# Altium schematic sheet Sensor-Comms-Sheet.SchDoc
size A4; SheetNumber: 4; SheetTotal: 8
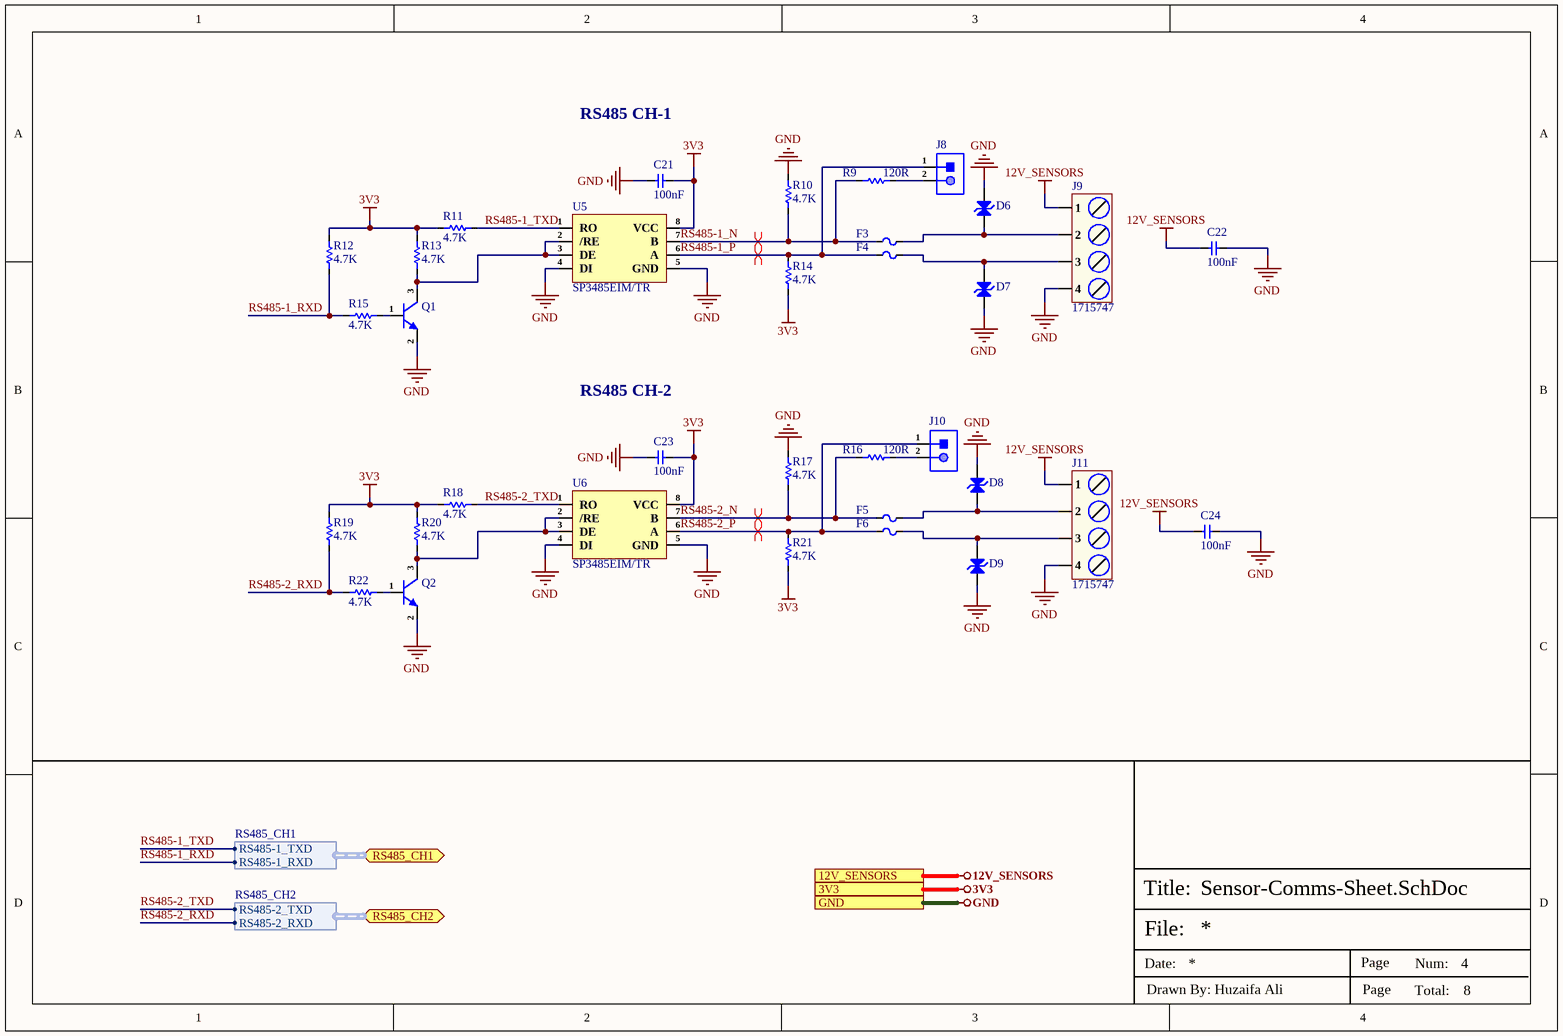
[diagram p0: Sensor-Comms-Sheet.SchDoc]

## Parts
C21  100nF  [Cap-0603]
C22  100nF  [Cap-0603]
C23  100nF  [Cap-0603]
C24  100nF  [Cap-0603]
D6  SMAJ12CA  [SMA Bi Directional]  (value not drawn)
D7  SMAJ12CA  [SMA Bi Directional]  (value not drawn)
D8  SMAJ12CA  [SMA Bi Directional]  (value not drawn)
D9  SMAJ12CA  [SMA Bi Directional]  (value not drawn)
F3  SMD0805P020TF  [Fuse-0805]  (value not drawn)
F4  SMD0805P020TF  [Fuse-0805]  (value not drawn)
F5  SMD0805P020TF  [Fuse-0805]  (value not drawn)
F6  SMD0805P020TF  [Fuse-0805]  (value not drawn)
J8  X6511WV-02H-C60D30  [HDR1X2_]  (value not drawn)
J9  1715747  [1715747]
J10  X6511WV-02H-C60D30  [HDR1X2_]  (value not drawn)
J11  1715747  [1715747]
Q1  MMBT3904M  [SOT-723]  (value not drawn)
Q2  MMBT3904M  [SOT-723]  (value not drawn)
R9  120R  [Res-0603]
R10  4.7K  [Res-0603]
R11  4.7K  [Res-0603]
R12  4.7K  [Res-0603]
R13  4.7K  [Res-0603]
R14  4.7K  [Res-0603]
R15  4.7K  [Res-0603]
R16  120R  [Res-0603]
R17  4.7K  [Res-0603]
R18  4.7K  [Res-0603]
R19  4.7K  [Res-0603]
R20  4.7K  [Res-0603]
R21  4.7K  [Res-0603]
R22  4.7K  [Res-0603]
U5  SP3485EIM/TR  [SOP-8]
U6  SP3485EIM/TR  [SOP-8]

## Ports
3V3 (see Top-Sheet[1B], ADC-Sheet[3D], Buttons-Sheet[3D], Controller-Sheet[3D], IO-Expander-Sheet[3D], Power-Sheet[3D]), 12V_SENSORS (see Top-Sheet[1B], Power-Sheet[3D]), GND (see Top-Sheet[1B], ADC-Sheet[3D], Buttons-Sheet[3D], Controller-Sheet[3D], IO-Expander-Sheet[3D], Power-Sheet[3D], Relay-Sheet[3D]), RS485_CH1 (bidir, harness RS485_CH1, see Top-Sheet[2B], Controller-Sheet[1D]), RS485_CH2 (bidir, harness RS485_CH2, see Top-Sheet[2B], Controller-Sheet[1D])

## Harnesses
RS485_CH2: RS485-2_TXD, RS485-2_RXD
RS485_CH1: RS485-1_TXD, RS485-1_RXD

## Nets
3V3: C21.1 C23.1 R11.1 R12.2 R13.2 R14.1 R18.1 R19.2 R20.2 R21.1 U5.8(VCC) U6.8(VCC) ; port 3V3
12V_SENSORS: C22.2 C24.2 J9.1 J11.1 ; port 12V_SENSORS
GND: C21.2 C22.1 C23.2 C24.1 D6.2(K) D7.1(A) D8.2(K) D9.1(A) J9.4 J11.4 Q1.2(E) Q2.2(E) R10.2 R17.2 U5.4(DI) U5.5(GND) U6.4(DI) U6.5(GND) ; port GND
RS485-1_N: F3.1 R9.1 R10.1 U5.7(B)
RS485-1_P: F4.1 J8.1 R14.2 U5.6(A)
RS485-1_RXD: R12.1 R15.2 ; port RS485_CH1.RS485-1_RXD
RS485-1_TXD: R11.2 U5.1(RO) ; port RS485_CH1.RS485-1_TXD
RS485-2_N: F5.1 R16.1 R17.1 U6.7(B)
RS485-2_P: F6.1 J10.1 R21.2 U6.6(A)
RS485-2_RXD: R19.1 R22.2 ; port RS485_CH2.RS485-2_RXD
RS485-2_TXD: R18.2 U6.1(RO) ; port RS485_CH2.RS485-2_TXD
NetD6_1: D6.1(A) F3.2 J9.2
NetD7_2: D7.2(K) F4.2 J9.3
NetD8_1: D8.1(A) F5.2 J11.2
NetD9_2: D9.2(K) F6.2 J11.3
NetJ8_2: J8.2 R9.2
NetJ10_2: J10.2 R16.2
NetQ1_1: Q1.1(B) R15.1
NetQ1_3: Q1.3(C) R13.1 U5.2(/RE) U5.3(DE)
NetQ2_1: Q2.1(B) R22.1
NetQ2_3: Q2.3(C) R20.1 U6.2(/RE) U6.3(DE)

## Layout directives
differential pair; net class RS485; differential pair class RS485_Lines; rule Impedance Constraint [Min = 120.0    Max = 120.0    ]; rule Matched Net Lengths [Tolerance = 50mil]: RS485-1_N, RS485-1_P, RS485-2_N, RS485-2_P

## Notes on the sheet
- RS485 CH-1
- RS485 CH-2
- File:
- Title:
- Date:
- Page
- Num:
- Total:
- Drawn By: Huzaifa Ali

## Library data of the parts
C21-C24 = CC0603KRX5R9BB104: CAP CER 0.1UF 50V X5R 0603; Manufacturer: Yageo; Tolerance: 10%; Item Type: Capacitor; Supplier 1: Digi-Key; Manufacturer Part Number: CC0603KRX5R9BB104; RoHS: Yes; Category: Ceramic Capacitors; Stock 1: 152253; Pricing 1: 1=0.10000, 10=0.05200, 50=0.02820, 100=0.02310, 500=0.01648, 1000=0.01294 (USD); Mount: Surface Mount; Case/Package: 0603; Case Code (Imperial): 0603; Case Code (Metric): 1608; Weight: 7.1E-05oz; Min Operating Temperature: -55°C; Max Operating Temperature: 85°C; Capacitance: 100nF; Packaging: Tape and Reel; Voltage Rating: 50V; Dielectric: X5R; Termination: SMD/SMT; Voltage Rating (DC): 50V; Package Quantity: 4000; Length: 0.063inch; Width: 0.031inch; Thickness: 0.035inch; Lead Free: Lead Free; Halogen Free: Halogen Free; ComponentLink1URL: http://www.mouser.com/ds/2/447/Yageo_UPY-GP_NP0_16V-to-50V_9-358835.pdf?src-supplier=Mouser; ComponentLink1Description: http://www.mouser.com/ds/2/447/Yageo_UPY-GP_NP0_16V-to-50V_9-358835.pdf?src-supplier=Mouser; ComponentLink2URL: https://www.yageo.com/upload/media/product/productsearch/datasheet/mlcc/UPY-GPHC_X5R_4V-to-50V_26.pdf?src-supplier=Digi-Key; ComponentLink2Description: https://www.yageo.com/upload/media/product/productsearch/datasheet/mlcc/UPY-GPHC_X5R_4V-to-50V_26.pdf?src-supplier=Digi-Key; ComponentLink3URL: http://www.yageo.com/exep/pages/download/literatures/ProductSelectionGuide%202014_Final_2.pdf?src-supplier=Digi-Key; ComponentLink3Description: http://www.yageo.com/exep/pages/download/literatures/ProductSelectionGuide%202014_Final_2.pdf?src-supplier=Digi-Key; Supplier Part Number 1: 311-4046-1-ND; LCSC Part Number: C110022
D6-D9 = SMAJ12CA: 20.1A 19.9V 13.3V 12V SMA(DO-214AC) Electrostatic and Surge Protection (TVS/ESD) ROHS; Manufacturer: MDD; Manufacturer Part Number: SMAJ12CA; Package: SMA(DO-214AC); LCSC Part Number: C110042; Item Type: (TVS/ESD); ComponentLink1Description: LCSC; ComponentLink1URL: https://www.lcsc.com/product-detail/Electrostatic-and-Surge-Protection-TVS-ESD_MDD-Microdiode-Semiconductor-SMAJ12CA_C110042.html
F3-F6 = SMD0805P020TF: 9V 200mA 100A 500mA 0805 Resettable Fuses ROHS; Manufacturer: RUILON; Item Type: Fuse; Manufacturer Part Number: SMD0805P020TF; Package: 0805; LCSC Part Number: C20976; ComponentLink1Description: LCSC; ComponentLink1URL: https://www.lcsc.com/product-detail/Resettable-Fuses_RUILON-Shenzhen-Ruilongyuan-Elec-SMD0805P020TF_C20976.html
J8 J10 = X6511WV-02H-C60D30: Gold 250V 3A Straight Square Pins 2.5mm 2P 260℃ 6mm -40℃~+105℃ 3mm 2.54mm Plugin Black Brass 1x2P Plugin,P=2.54mm Pin Headers ROHS; Manufacturer: XKB; Item Type: Male Header; Manufacturer Part Number: X6511WV-02H-C60D30; Package: Plugin,P=2.54mm; LCSC Part Number: C706874; ComponentLink1Description: LCSC; ComponentLink1URL: https://www.lcsc.com/product-detail/Pin-Headers_XKB-Connectivity-X6511WV-02H-C60D30_C706874.html
J9 J11 = 1715747: TERM BLK 4P SIDE ENT 5.08MM PCB; Manufacturer: Phoenix Contact; Item Type: Terminal Blocks; Supplier: Digikey; Supplier Part Number: 277-1265-ND; Manufacturer Part Number: 1715747; RoHS: Yes; Stock: 3401; Pricing: 1=2.39, 10=2.287, 50=2.188, 100=2.1282, 250=1.989, 500=1.82988, 1000=1.79562 (USD); ComponentLink1URL: https://datasheet.ciiva.com/16071/1715747-16071928.pdf?src-supplier=Onlinecomponents.com; ComponentLink1Description: https://datasheet.ciiva.com/16071/1715747-16071928.pdf?src-supplier=Onlinecomponents.com; ComponentLink2URL: https://datasheet.ciiva.com/23596/100425-23596240.pdf?src-supplier=Newark; ComponentLink2Description: https://datasheet.ciiva.com/23596/100425-23596240.pdf?src-supplier=Newark; ComponentLink3URL: https://datasheet.ciiva.com/15169/getdatasheetpartid-227081-15169962.pdf?src-supplier=Verical; ComponentLink3Description: https://datasheet.ciiva.com/15169/getdatasheetpartid-227081-15169962.pdf?src-supplier=Verical; ComponentLink4URL: https://datasheet.ciiva.com/11757/0900766b811d7317-11757713.pdf?src-supplier=Rs; ComponentLink4Description: https://datasheet.ciiva.com/11757/0900766b811d7317-11757713.pdf?src-supplier=Rs; ComponentLink5URL: https://datasheet.ciiva.com/824/1715747-824336.pdf?src-supplier=Digikey; ComponentLink5Description: https://datasheet.ciiva.com/824/1715747-824336.pdf?src-supplier=Digikey; ComponentLink6URL: https://datasheet.ciiva.com/1120/1731555-1120440.pdf?src-supplier=Farnell; ComponentLink6Description: https://datasheet.ciiva.com/1120/1731555-1120440.pdf?src-supplier=Farnell; ComponentLink7URL: https://datasheet.ciiva.com/1118/1731555-1118428.pdf?src-supplier=Element14; ComponentLink7Description: https://datasheet.ciiva.com/1118/1731555-1118428.pdf?src-supplier=Element14; ComponentLink8URL: https://datasheet.ciiva.com/33106/1715747-33106010.pdf?src-supplier=Today+Components; ComponentLink8Description: https://datasheet.ciiva.com/33106/1715747-33106010.pdf?src-supplier=Today+Components; ComponentLink9URL: https://datasheet.ciiva.com/29218/743477-da-01-en-printklemmenblock-mkds-1-5-4-5-08-29218070.pdf?src-supplier=Conrad; ComponentLink9Description: https://datasheet.ciiva.com/29218/743477-da-01-en-printklemmenblock-mkds-1-5-4-5-08-29218070.pdf?src-supplier=Conrad
Q1 Q2 = MMBT3904M: 40V 100mW 100@10mA,1V 200mA 300MHz 300mV@50mA,5mA NPN -55℃~+150℃@(Tj) SOT-723 Bipolar Transistors - BJT ROHS; Manufacturer: TECH PUBLIC; Item Type: Mosfet; ComponentLink1Description: LCSC; ComponentLink1URL: https://www.lcsc.com/product-detail/Bipolar-Transistors-BJT_TECH-PUBLIC-MMBT3904M_C2923360.html; Manufacturer Part Number: MMBT3904M; Package: SOT-723; LCSC Part Number: C2923360
R9 R16 = RC0603FR-07120RL: RES 120 OHM 1% 1/10W 0603; Manufacturer: Yageo; Temperature Coefficient: 100ppm/°C; Voltage Rating (DC): 50V; Power Rating: 100mW; Item Type: Resistor; Supplier 1: Digi-Key; Manufacturer Part Number: RC0603FR-07120RL; RoHS: Yes; Category: Chip SMD Resistors; Stock 1: 839061; Pricing 1: 1=0.10000, 10=0.02400, 100=0.00970, 1000=0.00436, 2500=0.00378 (USD); Case/Package: 0603; Number of Pins: 2; Case Code (Metric): 1608; Case Code (Imperial): 0603; Size Code: 0603; Min Operating Temperature: -55°C; Max Operating Temperature: 155°C; Resistance: 120R; Tolerance: 1%; Resistor Type: Thick Film; Packaging: Tape and Reel; Voltage Rating: 50V; Package Quantity: 1; Number of Terminations: 2; Termination: SMD/SMT; Max Power Dissipation: 100mW; Features: Moisture Resistant; Series: RC; Construction: Rectangular; Resistance Tolerance: 1%; Length: 1.6mm; Width: 0.031inch; Height: 0.022inch; Depth: 0.8mm; REACH SVHC: No SVHC; Lead Free: Lead Free; Military Standard: Not; RoHS Compliant: Yes; ComponentLink1URL: https://datasheet.ciiva.com/2553/pyu-r-int-thick-7-2553512.pdf?src-supplier=Digi-Key; ComponentLink1Description: https://datasheet.ciiva.com/2553/pyu-r-int-thick-7-2553512.pdf?src-supplier=Digi-Key; ComponentLink2URL: https://datasheet.ciiva.com/7746/443971-7746248.pdf?src-supplier=Element14; ComponentLink2Description: https://datasheet.ciiva.com/7746/443971-7746248.pdf?src-supplier=Element14; ComponentLink3URL: https://datasheet.ciiva.com/2553/pyu-r-int-thick-7-2553513.pdf?src-supplier=Digi-Key; ComponentLink3Description: https://datasheet.ciiva.com/2553/pyu-r-int-thick-7-2553513.pdf?src-supplier=Digi-Key; ComponentLink4URL: https://datasheet.ciiva.com/7746/443971-7746249.pdf?src-supplier=Element14; ComponentLink4Description: https://datasheet.ciiva.com/7746/443971-7746249.pdf?src-supplier=Element14; ComponentLink5URL: https://datasheet.ciiva.com/2553/pyu-r-int-thick-7-2553514.pdf?src-supplier=Digi-Key; ComponentLink5Description: https://datasheet.ciiva.com/2553/pyu-r-int-thick-7-2553514.pdf?src-supplier=Digi-Key; ComponentLink6URL: https://datasheet.ciiva.com/46395/443971-46395021.pdf?src-supplier=Element14; ComponentLink6Description: https://datasheet.ciiva.com/46395/443971-46395021.pdf?src-supplier=Element14; Supplier Part Number 1: 311-120HRCT-ND; LCSC Part Number: C114640
R10-R15 R17-R22 = RC0603FR-074K7L: RES SMD 4.7K OHM 1% 1/10W 0603; Manufacturer: Yageo; Item Type: Resistor; Manufacturer Part Number: RC0603FR-074K7L; Package: 0603; ComponentLink7Description: LCSC; ComponentLink7URL: https://www.lcsc.com/product-detail/Chip-Resistor-Surface-Mount_YAGEO-RC0603FR-074K7L_C99782.html; LCSC Part Number: C99782
U5 U6 = SP3485EIM/TR: SOP-8 RS-485/RS-422 ICs ROHS; Manufacturer: HGSEMI; Item Type: IC; Manufacturer Part Number: SP3485EIM/TR; Package: SOP-8; LCSC Part Number: C519086; ComponentLink1Description: LCSC; ComponentLink1URL: https://www.lcsc.com/product-detail/RS-485-RS-422-ICs_HGSEMI-SP3485EIM-TR_C519086.html